# Altium schematic sheet 单片机实验板电路原理图.SchDoc
size A4
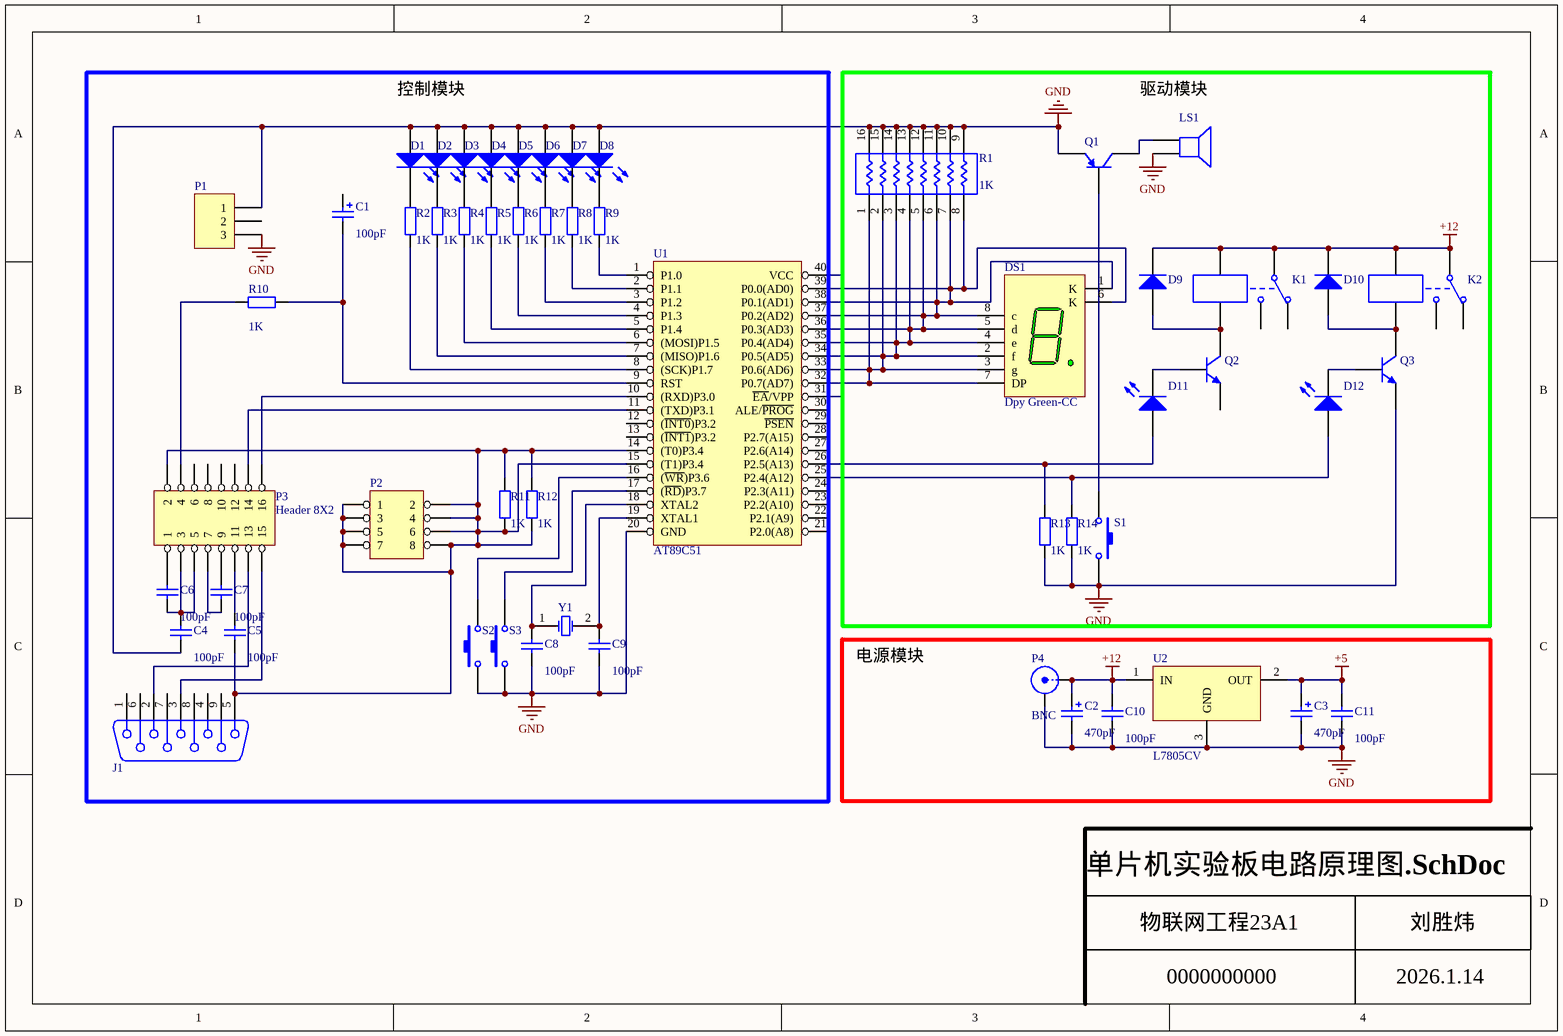
[diagram p0: 单片机实验板电路原理图.SchDoc]

## Parts
C1  value 100pF  [C0805]  (hidden comment: Cap Pol3)
C2  value 470pF  [C0805]  (hidden comment: Cap Pol3)
C3  value 470pF  [C0805]  (hidden comment: Cap Pol3)
C4  value 100pF  [RAD-0.3]  (hidden comment: Cap)
C5  value 100pF  [RAD-0.3]  (hidden comment: Cap)
C6  value 100pF  [RAD-0.3]  (hidden comment: Cap)
C7  value 100pF  [RAD-0.3]  (hidden comment: Cap)
C8  value 100pF  [RAD-0.3]  (hidden comment: Cap)
C9  value 100pF  [RAD-0.3]  (hidden comment: Cap)
C10  value 100pF  [RAD-0.3]  (hidden comment: Cap)
C11  value 100pF  [RAD-0.3]  (hidden comment: Cap)
D1  LED3  [3.5X2.8X1.9]  (value not drawn)
D2  LED3  [3.5X2.8X1.9]  (value not drawn)
D3  LED3  [3.5X2.8X1.9]  (value not drawn)
D4  LED3  [3.5X2.8X1.9]  (value not drawn)
D5  LED3  [3.5X2.8X1.9]  (value not drawn)
D6  LED3  [3.5X2.8X1.9]  (value not drawn)
D7  LED3  [3.5X2.8X1.9]  (value not drawn)
D8  LED3  [3.5X2.8X1.9]  (value not drawn)
D9  Diode  [SMC]  (value not drawn)
D10  Diode  [SMC]  (value not drawn)
D11  LED3  [3.5X2.8X1.9]  (value not drawn)
D12  LED3  [3.5X2.8X1.9]  (value not drawn)
DS1  Dpy Green-CC  [A]
J1  D Connector 9  [DSUB1.385-2H9]  (value not drawn)
K1  Relay  [MODULE5B]  (value not drawn)
K2  Relay  [MODULE5B]  (value not drawn)
LS1  Speaker  [PIN2]  (value not drawn)
P1  Header 3  [HDR1X3]  (value not drawn)
P2  Header 4X2H  [HDR2X4H]  (value not drawn)
P3  Header 8X2  [HDR2X8]
P4  BNC  [BNC_RA CON]
Q1  PNP  [SOT-23B_N]  (value not drawn)
Q2  QNPN  [SOT-23B_N]  (value not drawn)
Q3  QNPN  [SOT-23B_N]  (value not drawn)
R1  value 1K  [SO-16_N]  (hidden comment: Res Pack3)
R2  value 1K  [AXIAL-0.4]  (hidden comment: Res2)
R3  value 1K  [AXIAL-0.4]  (hidden comment: Res2)
R4  value 1K  [AXIAL-0.4]  (hidden comment: Res2)
R5  value 1K  [AXIAL-0.4]  (hidden comment: Res2)
R6  value 1K  [AXIAL-0.4]  (hidden comment: Res2)
R7  value 1K  [AXIAL-0.4]  (hidden comment: Res2)
R8  value 1K  [AXIAL-0.4]  (hidden comment: Res2)
R9  value 1K  [AXIAL-0.4]  (hidden comment: Res2)
R10  value 1K  [AXIAL-0.4]  (hidden comment: Res2)
R11  value 1K  [AXIAL-0.4]  (hidden comment: Res2)
R12  value 1K  [AXIAL-0.4]  (hidden comment: Res2)
R13  value 1K  [AXIAL-0.4]  (hidden comment: Res2)
R14  value 1K  [AXIAL-0.4]  (hidden comment: Res2)
S1  SW-PB  [SPST-2]  (value not drawn)
S2  SW-PB  [SPST-2]  (value not drawn)
S3  SW-PB  [SPST-2]  (value not drawn)
U1  AT89C51  [MHDR2X20]
U2  L7805CV  [TO-126]
Y1  XTAL  [R38]  (value not drawn)

## Blocks framed on the sheet
控制模块: C1 C4-C9 D1-D8 J1 P1-P3 R2-R12 S2 S3 U1 Y1
驱动模块: D9-D12 DS1 K1 K2 LS1 Q1-Q3 R1 R13 R14 S1
电源模块: C2 C3 C10 C11 P4 U2

## Nets
+5: C3.1 C11.2 U2.2(OUT)
+12: C2.1 C10.2 D9.2(K) D10.2(K) K1.1 K1.4 K2.1 K2.4 P4.1(X) U2.1(IN)
GND: C2.2 C3.2 C4.1 C8.1 C9.1 C10.1 C11.1 D1.1(A) D2.1(A) D3.1(A) D4.1(A) D5.1(A) D6.1(A) D7.1(A) D8.1(A) LS1.2 P1.1 P1.3 P4.2(Y) Q1.3(E) Q3.3(E) R1.9 R1.10 R1.11 R1.12 R1.13 R1.14 R1.15 R1.16 R13.1 R14.1 S1.1 S2.1 S3.1 U1.20(GND) U2.3(GND)
NetC1_2: C1.2 R10.1 U1.9(RST)
NetC4_2: C4.2 C6.1 P3.3 P3.5
NetC5_1: C5.1 J1.5 P2.1 P2.2 P2.3 P2.4 P2.5 P2.6 P2.7 P2.8 P3.2 R11.1 R11.2 R12.1 R12.2 U1.14((T0)P3.4) U1.15((T1)P3.4)
NetC5_2: C5.2 P3.11
NetC6_2: C6.2 P3.1
NetC7_1: C7.1 P3.7
NetC7_2: C7.2 P3.9
NetC8_2: C8.2 U1.18(XTAL2) Y1.1(OSC1)
NetC9_2: C9.2 U1.19(XTAL1) Y1.2(OSC2)
NetD1_2: D1.2(K) R2.2
NetD2_2: D2.2(K) R3.2
NetD3_2: D3.2(K) R4.2
NetD4_2: D4.2(K) R5.2
NetD5_2: D5.2(K) R6.2
NetD6_2: D6.2(K) R7.2
NetD7_2: D7.2(K) R8.2
NetD8_2: D8.2(K) R9.2
NetD9_1: D9.1(A) K1.5 Q2.1(C)
NetD10_1: D10.1(A) K2.5 Q3.1(C)
NetD11_1: D11.1(A) R13.2 U1.26(P2.5(A13))
NetD11_2: D11.2(K) Q2.2(B)
NetD12_1: D12.1(A) R14.2 U1.25(P2.4(A12))
NetD12_2: D12.2(K) Q3.2(B)
NetDS1_1: DS1.1(K) DS1.2(f) DS1.3(g) DS1.4(e) DS1.5(d) DS1.6(K) DS1.7(DP) DS1.8(c) R1.1 R1.2 R1.3 R1.4 R1.5 R1.6 R1.7 R1.8 U1.32(P0.7(AD7)) U1.33(P0.6(AD6)) U1.34(P0.5(AD5)) U1.35(P0.4(AD4)) U1.36(P0.3(AD3)) U1.37(P0.2(AD2)) U1.38(P0.1(AD1)) U1.39(P0.0(AD0))
NetJ1_2: J1.2 P3.13
NetJ1_3: J1.3 P3.15
NetLS1_1: LS1.1 Q1.1(C)
NetP3_4: P3.4 R10.2
NetP3_14: P3.14 U1.11((TXD)P3.1)
NetP3_16: P3.16 U1.10((RXD)P3.0)
NetQ1_2: Q1.2(B) S1.2
NetR2_1: R2.1 U1.8((SCK)P1.7)
NetR3_1: R3.1 U1.7((MISO)P1.6)
NetR4_1: R4.1 U1.6((MOSI)P1.5)
NetR5_1: R5.1 U1.5(P1.4)
NetR6_1: R6.1 U1.4(P1.3)
NetR7_1: R7.1 U1.3(P1.2)
NetR8_1: R8.1 U1.2(P1.1)
NetR9_1: R9.1 U1.1(P1.0)
NetS2_2: S2.2 U1.16((~{WR})P3.6)
NetS3_2: S3.2 U1.17((~{RD})P3.7)
NetU1_31: U1.31(~{EA}/VPP) U1.40(VCC)

Not connected (* = marked no-connect by the designer): C1 1; J1 1 4 6 7 8 9; K1 2 3; K2 2 3; P1 2; P3 6 8 10 12; Q2 3(E); U1 12((~{INT0})P3.2) 13((~{INT1})P3.2) 21(P2.0(A8)) 22(P2.1(A9)) 23(P2.2(A10)) 24(P2.3(A11)) 27(P2.6(A14)) 28(P2.7(A15)) 29(~{PSEN}) 30(ALE/~{PROG})

## Notes on the sheet
- 物联网工程23A1
- 0000000000
- 2026.1.14
- 刘胜炜

## Library data of the parts
C1-C3 = Cap Pol3: Polarized Capacitor (Surface Mount); Published: 8-Jun-2000; LatestRevisionDate: 29-May-2009; LatestRevisionNote: IPC-7351 Footprint Added.; PackageReference: C0805; Publisher: Altium Limited; PackageDescription: Chip Capacitor
C4-C11 = Cap: Capacitor; Published: 8-Jun-2000; LatestRevisionDate: 17-Jul-2002; LatestRevisionNote: Re-released for DXP Platform.; PackageReference: RAD-0.3; Publisher: Altium Limited; PackageDescription: Radial Cap, Thru-Hole; 2 Leads; 0.3 in Pin Spacing
D1-D8 D11 D12 = LED3: Typical BLUE SiC LED; Published: 8-Jun-2000; LatestRevisionDate: 17-Dec-2003; LatestRevisionNote: PCB Footprint replaced.; DatasheetVersion: 16-Apr-2002; PackageVersion: 16-Apr-2002; PackageReference: 3.5X2.8X1.9; Publisher: Altium Limited; PackageDescription: SM LED; 2 C-Bend Leads; Body 3.5 x 2.8 x 1.9 mm, inc leads (LxWxH typ)
D9 D10 = Diode: Default Diode; Published: 8-Jun-2000; LatestRevisionDate: 17-Jul-2002; LatestRevisionNote: Re-released for DXP Platform.; PackageVersion: Sep-1996; PackageReference: SMC; Publisher: Altium Limited; PackageDescription: DO-214-AB/SMC; 2 C-Bend Leads; Body 7.9 x 5.9 mm, inc. leads (LxW); Code_JEDEC: DO-214-AB
DS1 = Dpy Green-CC: 7.62 mm Black Surface Green 7-Segment Display: CC, RH DP; MinimumIntensity: 860 ucd; Note: IF = 10 mA; Note: Pins 1 and 6 are redundant Cathodes.; Published: 8-Jun-2000; LatestRevisionDate: 17-Dec-2003; LatestRevisionNote: Schematic revised, PCB Footprint replaced.; DatasheetVersion: 19-Feb-2002; PackageVersion: 11-Feb-2002; PackageReference: A; Publisher: Altium Limited; PackageDescription: LED, 7-Segment Display, 7.62 mm, RHD; 10 Leads; Row Space 5.08 mm; Pitch 2.54 mm; Colour: Green; ComponentLink1Description: Manufacturer Link; ComponentLink1URL: http://www.agilent.com/
J1 = D Connector 9: Receptacle Assembly, 9 Position, Right Angle; PackageDocument: O; Positions: 9; Published: 15-Jun-2001; LatestRevisionDate: 17-Jul-2002; LatestRevisionNote: Re-released for DXP Platform.; DatasheetDocument: 1-Sep-1999; PackageReference: 788750; Publisher: Altium Limited; Orientation: Right Angle; Gender: Receptacle
K1 K2 = Relay-SPDT: Single-Pole Dual-Throw Relay; Published: 24-Mar-1999; LatestRevisionDate: 17-Jul-2002; LatestRevisionNote: Re-released for DXP Platform.; PackageReference: MODULE5B; Publisher: Altium Limited
LS1 = Speaker: Loudspeaker; Published: 24-Mar-1999; LatestRevisionDate: 17-Jul-2002; LatestRevisionNote: Re-released for DXP Platform.; PackageReference: PIN2; Publisher: Altium Limited
P1 = Header 3: Header, 3-Pin; LatestRevisionDate: 17-Jul-2002; LatestRevisionNote: Re-released for DXP Platform.; Publisher: Altium Limited
P2 = Header 4X2H: Header, 4-Pin, Dual row, Right Angle; LatestRevisionDate: 17-Jul-2002; LatestRevisionNote: Re-released for DXP Platform.; Publisher: Altium Limited
P3 = Header 8X2: Header, 8-Pin, Dual row; LatestRevisionDate: 17-Jul-2002; LatestRevisionNote: Re-released for DXP Platform.; Publisher: Altium Limited
P4 = BNC: BNC Elbow Connector; LatestRevisionDate: 17-Jul-2002; LatestRevisionNote: Re-released for DXP Platform.; Publisher: Altium Limited
Q1 = PNP: PNP Bipolar Transistor; Published: 8-Jun-2000; LatestRevisionDate: 29-May-2009; LatestRevisionNote: IPC-7351 Footprint Added.; PackageVersion: Aug-1999; PackageReference: SOT-23B; Publisher: Altium Limited; PackageDescription: 3-Pin SOT-23 Package 0.95 mm Pitch, 2.4 mm Lead Span
Q2 Q3 = QNPN: NPN Bipolar Transistor; Published: 8-Jun-2000; LatestRevisionDate: 29-May-2009; LatestRevisionNote: IPC-7351 Footprint Added.; PackageVersion: Aug-1999; PackageReference: SOT-23B; Publisher: Altium Limited; PackageDescription: 3-Pin SOT-23 Package 0.95 mm Pitch, 2.4 mm Lead Span
R1 = Res Pack3: Isolated Resistor Network; Published: 24-Mar-1999; LatestRevisionDate: 29-May-2009; LatestRevisionNote: IPC-7351 Footprint Added.; PackageReference: SO-16; Publisher: Altium Limited; PackageDescription: 16-Pin Small Outline Integrated Circuit 1.27 mm Pitch; Code_JEDEC: MS-012-AC; Code_IPC: SOIC127P600-16
R2-R14 = Res2: Resistor; Published: 8-Jun-2000; LatestRevisionDate: 17-Jul-2002; LatestRevisionNote: Re-released for DXP Platform.; PackageReference: AXIAL-0.4; Publisher: Altium Limited; PackageDescription: Axial Device, Thru-Hole; 2 Leads; 0.4 in Pin Spacing
S1-S3 = SW-PB: Switch; Published: 24-Mar-1999; LatestRevisionDate: 17-Jul-2002; LatestRevisionNote: Re-released for DXP Platform.; PackageReference: SPST-2; Publisher: Altium Limited; PackageDescription: Switch; 2 Leads
U1 = MHDR2X20: Header, 20-Pin, Dual row; LatestRevisionDate: 17-Jul-2002; LatestRevisionNote: Re-released for DXP Platform.; Publisher: Altium Limited
Y1 = XTAL: Crystal Oscillator; Published: 8-Jun-2000; LatestRevisionDate: 17-Jul-2002; LatestRevisionNote: Re-released for DXP Platform.; PackageReference: R38; Publisher: Altium Limited; PackageDescription: Crystal, Thru-Hole; 2 Leads; Body 3.1 x 8.2 mm (Dia.xH)